# Altium schematic sheet Lamp.SchDoc
size A4
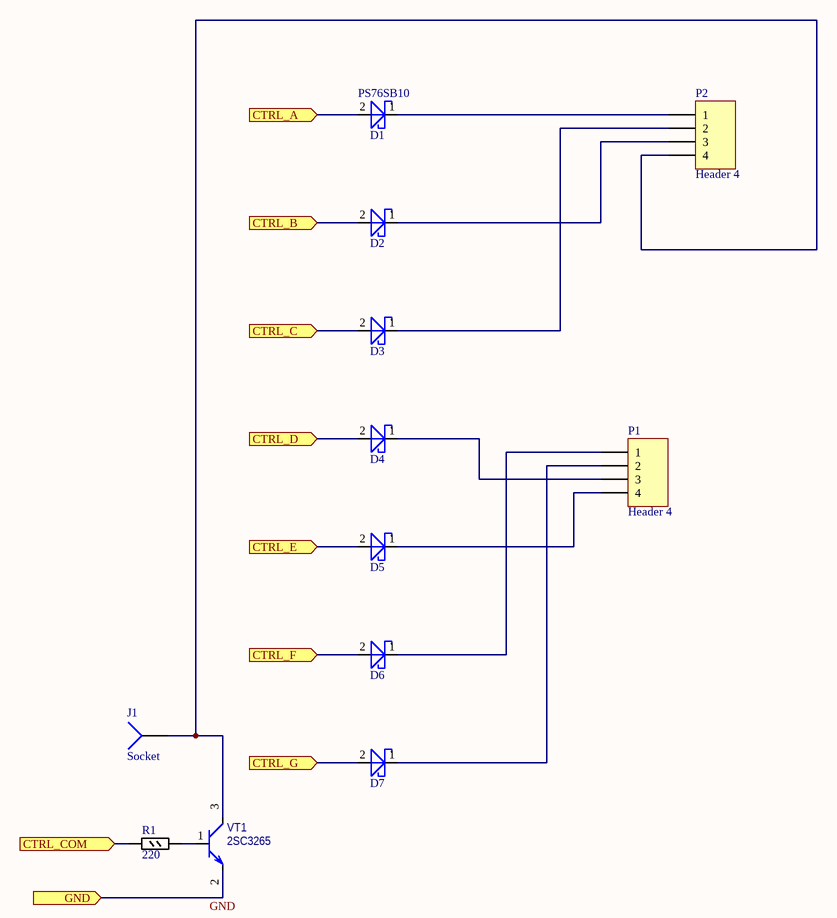
[diagram p0: Lamp.SchDoc]

## Parts
D1  PS76SB10  [SOD2512X115N]
D2  1A 20V  [SOD2512X115N]  (value not drawn)
D3  1A 20V  [SOD2512X115N]  (value not drawn)
D4  1A 20V  [SOD2512X115N]  (value not drawn)
D5  1A 20V  [SOD2512X115N]  (value not drawn)
D6  1A 20V  [SOD2512X115N]  (value not drawn)
D7  1A 20V  [SOD2512X115N]  (value not drawn)
J1  Socket  [PIN1]
P1  Header 4  [HDR1X4]
P2  Header 4  [HDR1X4]
R1  220  [RESC2012(0805)N]
VT1  2SC3265  [SOT23-3N]

## Ports
CTRL_A (in), CTRL_B (in), CTRL_C (in), CTRL_COM (in), CTRL_D (in), CTRL_E (in), CTRL_F (in), CTRL_G (in), GND (in)

## Nets
CTRL_A: D1.2(A) ; port CTRL_A
CTRL_B: D2.2(A) ; port CTRL_B
CTRL_C: D3.2(A) ; port CTRL_C
CTRL_COM: R1.1 ; port CTRL_COM
CTRL_D: D4.2(A) ; port CTRL_D
CTRL_E: D5.2(A) ; port CTRL_E
CTRL_F: D6.2(A) ; port CTRL_F
CTRL_G: D7.2(A) ; port CTRL_G
GND: VT1.2(E) ; port GND
NetD1_1: D1.1(K) P2.1
NetD2_1: D2.1(K) P2.3
NetD3_1: D3.1(K) P2.2
NetD4_1: D4.1(K) P1.3
NetD5_1: D5.1(K) P1.4
NetD6_1: D6.1(K) P1.1
NetD7_1: D7.1(K) P1.2
NetJ1_1: J1.1 P2.4 VT1.3(C)
NetR1_2: R1.2 VT1.1(B)

## Library data of the parts
D1-D7 = B5817WS: DIODE SCHOTTKY 20V 1A SOD323; Part Number: B5817WS; HelpURL: https://www.digikey.com/en/products/detail/yangzhou-yangjie-electronic-technology-co-ltd/B5817WS/13911879; Digi-Key Part Number: 3191-B5817WSCT-ND; Manufacturer Part Number: B5817WS; Package: SOD-323
P1 P2 = Header 4: Header, 4-Pin; LatestRevisionDate: 17-Jul-2002; LatestRevisionNote: Re-released for DXP Platform.; Publisher: Altium Limited
R1 = RESC2012(0805): Part Number: RESC2012(0805); Package: 0805
VT1 = BC848: Part Number: BC848; HelpURL: http://www.nxp.com/documents/data_sheet/BC848_SER.pdf
J1 = Socket: LatestRevisionDate: 17-Jul-2002; LatestRevisionNote: Re-released for DXP Platform.; Publisher: Altium Limited